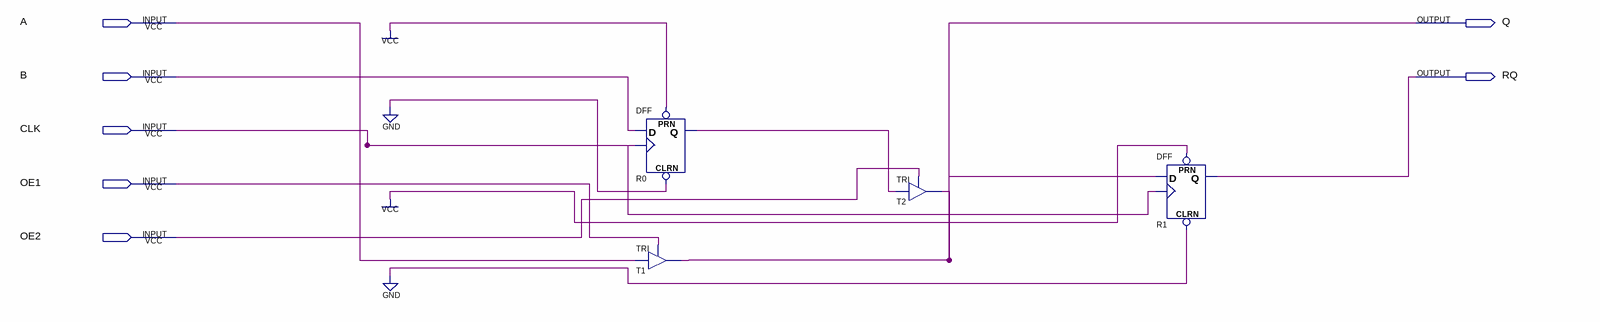
[diagram p0: schematic sheet]
// Quartus schematic TRIBUS4.bdf as structural Verilog: 4 symbols, 7 pins
module TRIBUS4 (
  input  A,
  input  B,
  input  CLK,
  input  OE1,
  input  OE2,
  output Q,
  output RQ
);

  wire R0_q;

  DFF R0 (.CLRN(1'b0), .CLK(CLK), .D(B), .PRN(1'b1), .Q(R0_q));
  TRI T1 (.IN(A), .OE(OE1), .OUT(Q));
  TRI T2 (.IN(R0_q), .OE(OE2), .OUT(Q));
  DFF R1 (.CLRN(1'b0), .CLK(CLK), .D(Q), .PRN(1'b1), .Q(RQ));
endmodule
